# Altium schematic sheet ADC_LTC2122.SchDoc: ADC
size A3; SheetNumber: 5; SheetTotal: 17
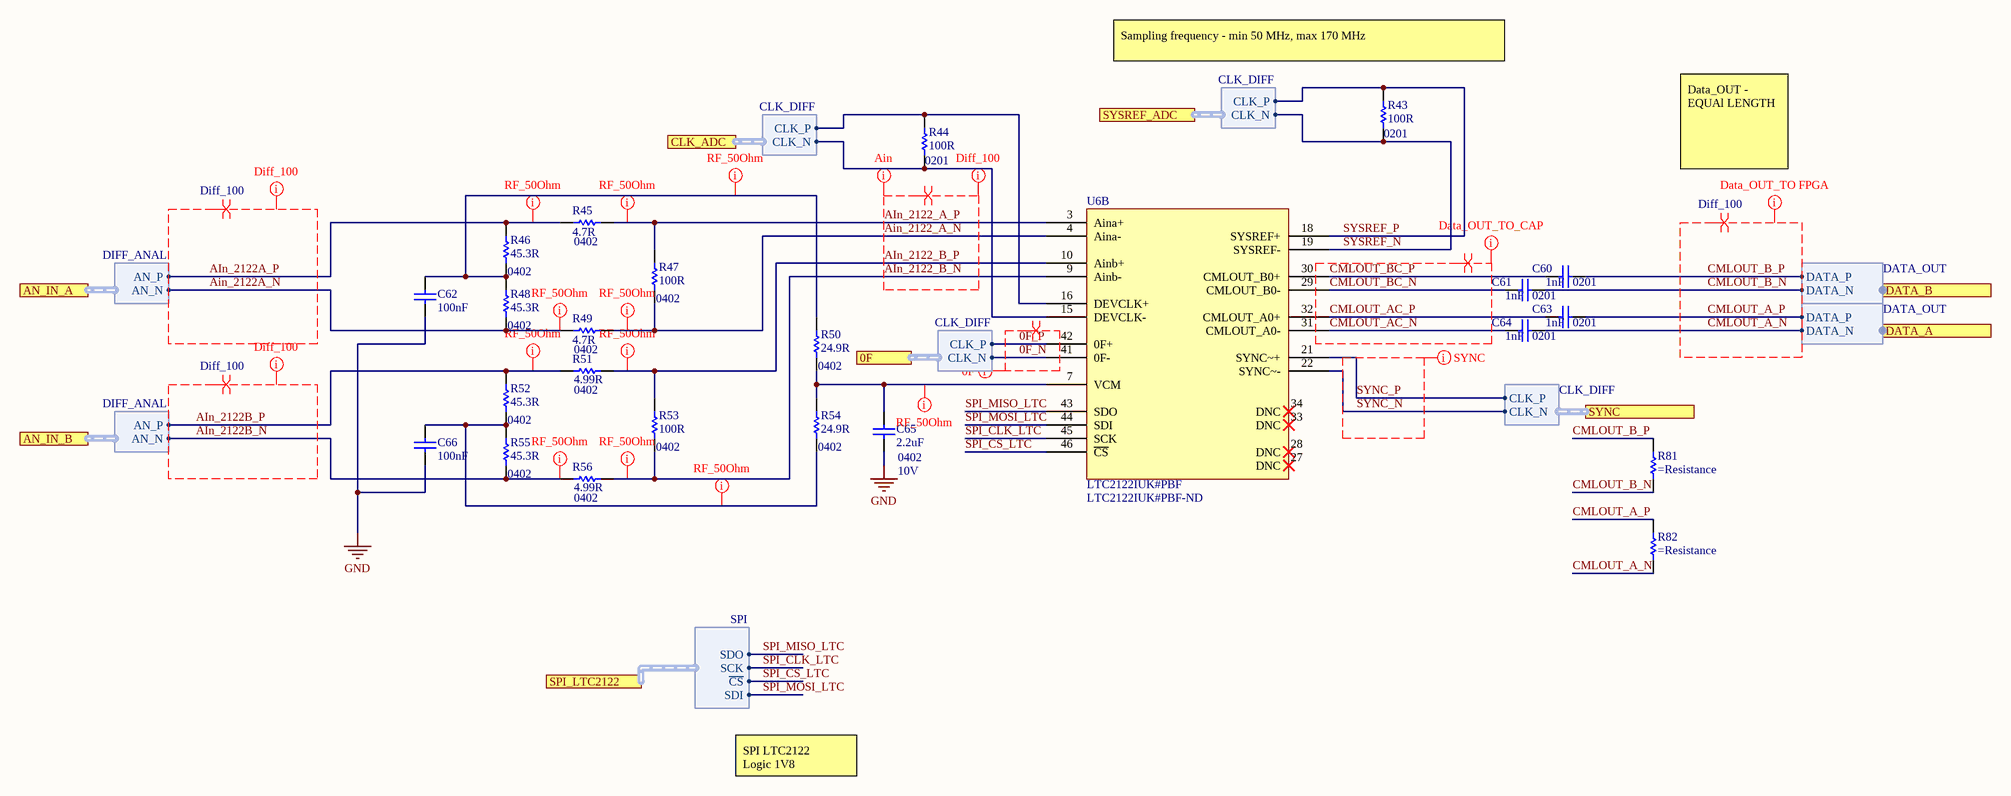
[diagram p0: ADC_LTC2122.SchDoc]

## Parts
C60  1nF  Case/Package: 0201  [CAP 0201/0603 KK]
C61  1nF  Case/Package: 0201  [CAP 0201/0603 KK]
C62  100nF  [CAP 0201/0603 KK]
C63  1nF  Case/Package: 0201  [CAP 0201/0603 KK]
C64  1nF  Case/Package: 0201  [CAP 0201/0603 KK]
C65  2.2uF  Case Code (Imperial): 0402  Voltage Rating: 10V  [CAP 0402/1005 RF KK]
C66  100nF  [CAP 0201/0603 KK]
R43  100R  Case/Package: 0201  [RES 0201/0603]
R44  100R  Case/Package: 0201  [RES 0201/0603]
R45  4.7R  Case/Package: 0402  [RES 0402/1005 RF KK]
R46  45.3R  Case Code (Imperial): 0402  [RES 0402/1005 RF KK]
R47  100R  Case/Package: 0402  [RES 0402/1005 RF KK]
R48  45.3R  Case Code (Imperial): 0402  [RES 0402/1005 RF KK]
R49  4.7R  Case/Package: 0402  [RES 0402/1005 RF KK]
R50  24.9R  Case/Package: 0402  [RES 0402/1005 RF KK]
R51  4.99R  Case/Package: 0402  [RES 0402/1005 RF KK]
R52  45.3R  Case Code (Imperial): 0402  [RES 0402/1005 RF KK]
R53  100R  Case/Package: 0402  [RES 0402/1005 RF KK]
R54  24.9R  Case/Package: 0402  [RES 0402/1005 RF KK]
R55  45.3R  Case Code (Imperial): 0402  [RES 0402/1005 RF KK]
R56  4.99R  Case/Package: 0402  [RES 0402/1005 RF KK]
R81  (no value)  [RES 0402/1005 RF KK]
R82  (no value)  [RES 0402/1005 RF KK]
U6  LTC2122IUK#PBF  Supplier Part Number 1: LTC2122IUK#PBF-ND  [LTC2122]  (part B of 2)

## Ports
0F (harness CLK_DIFF), AN_IN_A (harness DIFF_ANAL), AN_IN_B (harness DIFF_ANAL), CLK_ADC (harness CLK_DIFF), DATA_A (harness DATA_OUT), DATA_B (harness DATA_OUT), SPI_LTC2122 (harness SPI), SYNC (harness CLK_DIFF), SYSREF_ADC (harness CLK_DIFF)

## Harnesses
DIFF_ANAL: AN_P, AN_N
CLK_DIFF: CLK_P, CLK_N
DATA_OUT: DATA_P, DATA_N
SPI: SCK, ~{CS}, SDO, SDI

## Nets
GND: C62.1 C65.1 C66.1
0F_N: U6.41(0F-) ; port 0F.CLK_N
0F_P: U6.42(0F+) ; port 0F.CLK_P
Ain_2122_A_N: R47.1 R49.2 U6.4(Aina-)
AIn_2122_A_P: R45.2 R47.2 U6.3(Aina+)
AIn_2122_B_N: R53.1 R56.2 U6.9(Ainb-)
AIn_2122_B_P: R51.2 R53.2 U6.10(Ainb+)
Ain_2122A_N: R48.1 R49.1 ; port AN_IN_A.AN_N
AIn_2122A_P: R45.1 R46.2 ; port AN_IN_A.AN_P
AIn_2122B_N: R55.1 R56.1 ; port AN_IN_B.AN_N
AIn_2122B_P: R51.1 R52.2 ; port AN_IN_B.AN_P
CMLOUT_A_N: C64.2 R82.1 ; port DATA_A.DATA_N
CMLOUT_A_P: C63.2 R82.2 ; port DATA_A.DATA_P
CMLOUT_AC_N: C64.1 U6.31(CMLOUT_A0-)
CMLOUT_AC_P: C63.1 U6.32(CMLOUT_A0+)
CMLOUT_B_N: C61.2 R81.1 ; port DATA_B.DATA_N
CMLOUT_B_P: C60.2 R81.2 ; port DATA_B.DATA_P
CMLOUT_BC_N: C61.1 U6.29(CMLOUT_B0-)
CMLOUT_BC_P: C60.1 U6.30(CMLOUT_B0+)
SPI_CLK_LTC: U6.45(SCK) ; port SPI_LTC2122.SCK
SPI_CS_LTC: U6.46(~{CS}) ; port SPI_LTC2122.~{CS}
SPI_MISO_LTC: U6.43(SDO) ; port SPI_LTC2122.SDO
SPI_MOSI_LTC: U6.44(SDI) ; port SPI_LTC2122.SDI
SYNC_N: U6.22(SYNC~-) ; port SYNC.CLK_N
SYNC_P: U6.21(SYNC~+) ; port SYNC.CLK_P
SYSREF_N: R43.1 U6.19(SYSREF-) ; port SYSREF_ADC.CLK_N
SYSREF_P: R43.2 U6.18(SYSREF+) ; port SYSREF_ADC.CLK_P
NetC62_2: C62.2 R46.1 R48.2 R50.2
NetC65_2: C65.2 R50.1 R54.2 U6.7(VCM)
NetC66_2: C66.2 R52.1 R54.1 R55.2
NetR44_1: R44.1 U6.15(DEVCLK-) ; port CLK_ADC.CLK_N
NetR44_2: R44.2 U6.16(DEVCLK+) ; port CLK_ADC.CLK_P

Not connected (* = marked no-connect by the designer): U6 27(DNC)* 28(DNC)* 33(DNC)* 34(DNC)*

## Layout directives
net class Single50: Ain_2122_A_N, AIn_2122_A_P, AIn_2122_B_N, AIn_2122_B_P, Ain_2122A_N, AIn_2122A_P, AIn_2122B_N, AIn_2122B_P, NetC62_2, NetC65_2, NetC66_2
net class Diff_100: Ain_2122_A_N, AIn_2122_A_P, AIn_2122_B_N, AIn_2122_B_P, Ain_2122A_N, AIn_2122A_P, AIn_2122B_N, AIn_2122B_P
differential pair; differential pair class Diff_100: 0F_N, 0F_P, Ain_2122_A_N, AIn_2122_A_P, AIn_2122_B_N, AIn_2122_B_P, Ain_2122A_N, AIn_2122A_P, AIn_2122B_N, AIn_2122B_P, CMLOUT_A_N, CMLOUT_A_P, CMLOUT_AC_N, CMLOUT_AC_P, CMLOUT_B_N, CMLOUT_B_P, CMLOUT_BC_N, CMLOUT_BC_P
net class Ain: Ain_2122_A_N, AIn_2122_A_P, AIn_2122_B_N, AIn_2122_B_P
net class SYNC; net class Diff_100: SYNC_N, SYNC_P
net class Data_OUT_TO FPGA: CMLOUT_A_N, CMLOUT_A_P, CMLOUT_B_N, CMLOUT_B_P
net class Data_OUT_TO_CAP: CMLOUT_AC_N, CMLOUT_AC_P, CMLOUT_BC_N, CMLOUT_BC_P
net class 0F: 0F_N, 0F_P

## Notes on the sheet
- (near R43) Sampling frequency - min 50 MHz, max 170 MHz
- Data_OUT - EQUAl LENGTH
- SPI LTC2122
  Logic 1V8
- Title
- Size:
- Date:
- A3
- Number:
- Time:
- Revision:
- Sheet
- of
- File:

## Library data of the parts
C60 C61 C63 C64 = Capacitor: Cap Ceramic 0.001uF 25V X7R 10% SMD 0201 125°C Paper T/R; Manufacturer: Murata; Manufacturer Part Number: GRM033R71E102KA01J; Supplier 1: Digi-Key; Supplier Part Number 1: 490-8161-1-ND; RoHS: Yes; Category: Ceramic Capacitors; Stock 1: 140332; Pricing 1: 1=0,10000, 10=0,02900, 100=0,01300, 500=0,00932, 1000=0,00732, 2500=0,00666, 5000=0,00612 (USD); Mount: Surface Mount; Case Code (Metric): 0603; Case Code (Imperial): 0201; Min Operating Temperature: -55°C; Max Operating Temperature: 125°C; Package Quantity: 50000; Packaging: Tape and Reel; Capacitance: 1nF; Tolerance: 10%; Voltage Rating: 25V; Voltage Rating (DC): 25V; Termination: SMD/SMT; Dielectric: X7R; Length: 0.6mm; Height: 0.3mm; Width: 0.012inch; Thickness: 0.013inch; Depth: 0.3mm; Radiation Hardening: No; ComponentLink1URL: https://datasheet.ciiva.com/5453/product-5453157.pdf?src-supplier=Mouser; ComponentLink1Description: https://datasheet.ciiva.com/5453/product-5453157.pdf?src-supplier=Mouser; ComponentLink2URL: https://datasheet.ciiva.com/11621/product-11621675.pdf?src-supplier=Avnet; ComponentLink2Description: https://datasheet.ciiva.com/11621/product-11621675.pdf?src-supplier=Avnet
C62 C66 = Capacitor: Manufacturer 1: Murata; Manufacturer Part Number 1: GRM033R61C104ME84D; Voltage Rating: 16V; Tolerance: 20%; Dielectric: X5R; Supplier 1: Digi-Key; Supplier Part Number 1: 490-9986-1-ND; Stock 1: 503570; Pricing 1: 1=0.10000, 10=0.05400, 100=0.02430, 500=0.01732, 1000=0.01361, 2500=0.01238, 5000=0.01139 (USD); RoHS: Yes; Mount: Surface Mount; Case/Package: 0201; Weight: 1.2E-05oz; Case Code (Metric): 0603; Case Code (Imperial): 0201; Min Operating Temperature: -55°C; Max Operating Temperature: 85°C; Capacitance: 100nF; Packaging: Tape and Reel; Termination: SMD/SMT; Voltage Rating (DC): 16V; Package Quantity: 15000; Length: 0.024inch; Height: 0.3mm; Width: 0.3mm; Thickness: 0.013inch; ComponentLink1URL: http://www.mouser.com/ds/2/281/c02e-2905.pdf?src-supplier=Mouser; ComponentLink1Description: http://www.mouser.com/ds/2/281/c02e-2905.pdf?src-supplier=Mouser; ComponentLink2URL: http://search.murata.co.jp/Ceramy/image/img/A01X/G101/ENG/GRM033R61C104ME84-01.pdf?src-supplier=Digi-Key; ComponentLink2Description: http://search.murata.co.jp/Ceramy/image/img/A01X/G101/ENG/GRM033R61C104ME84-01.pdf?src-supplier=Digi-Key
C65 = Capacitor: MURATA - GRM155R61A225KE95D - Keramikvielschichtkondensator, SMD, 2.2 µF, 10 V, 0402 [Metrisch 1005], ± 10%, X5R, Baureihe GRM; Material: Ceramic; Supplier 1: Digi-Key; Supplier Part Number 1: 490-10451-1-ND; Manufacturer: Murata; Manufacturer Part Number: GRM155R61A225KE95D; RoHS: Yes; Category: Ceramic Capacitors; Stock 1: 2215146; Pricing 1: 1=0,11000, 10=0,08100, 100=0,03800, 500=0,02664, 1000=0,02205, 2500=0,02052, 5000=0,01878 (USD); Mount: Surface Mount; Case/Package: 0402; Weight: 0.000212oz; Case Code (Metric): 1005; Min Operating Temperature: -55°C; Max Operating Temperature: 85°C; Dielectric: X5R; Termination: SMD/SMT; Voltage Rating (DC): 10V; Package Quantity: 10000; Capacitance: 2.2uF; Tolerance: 10%; Packaging: Tape and Reel; Length: 1mm; Height: 0.5mm; Thickness: 0.022inch; Depth: 0.5mm; Width: 0.5mm; REACH SVHC: No SVHC; Lead Free: Lead Free; ComponentLink1URL: http://www.mouser.com/ds/2/281/c02e-2905.pdf?src-supplier=Mouser; ComponentLink1Description: http://www.mouser.com/ds/2/281/c02e-2905.pdf?src-supplier=Mouser; ComponentLink2URL: http://components.arrow.com/part/dataview/0323_04264073?src-supplier=Arrow+Europe; ComponentLink2Description: http://components.arrow.com/part/dataview/0323_04264073?src-supplier=Arrow+Europe; ComponentLink3URL: http://www.farnell.com/datasheets/1872202.pdf?src-supplier=Farnell; ComponentLink3Description: http://www.farnell.com/datasheets/1872202.pdf?src-supplier=Farnell; ComponentLink4URL: http://www.farnell.com/datasheets/2047915.pdf?src-supplier=Farnell; ComponentLink4Description: http://www.farnell.com/datasheets/2047915.pdf?src-supplier=Farnell; ComponentLink5URL: http://www.farnell.com/datasheets/1872202.pdf?src-supplier=Element14; ComponentLink5Description: http://www.farnell.com/datasheets/1872202.pdf?src-supplier=Element14; ComponentLink6URL: http://www.farnell.com/datasheets/1872202.pdf?src-supplier=Newark; ComponentLink6Description: http://www.farnell.com/datasheets/1872202.pdf?src-supplier=Newark; ComponentLink7URL: http://psearch.en.murata.com/capacitor/product/GRM155R61A225KE95%23.pdf?src-supplier=Avnet; ComponentLink7Description: http://psearch.en.murata.com/capacitor/product/GRM155R61A225KE95%23.pdf?src-supplier=Avnet; ComponentLink8URL: http://www.farnell.com/datasheets/2047915.pdf?src-supplier=Element14; ComponentLink8Description: http://www.farnell.com/datasheets/2047915.pdf?src-supplier=Element14; ComponentLink9URL: https://search.murata.co.jp/Ceramy/image/img/A01X/G101/ENG/GRM155R61A225KE95-01.pdf?src-supplier=Digi-Key; ComponentLink9Description: https://search.murata.co.jp/Ceramy/image/img/A01X/G101/ENG/GRM155R61A225KE95-01.pdf?src-supplier=Digi-Key; ComponentLink10URL: http://www.farnell.com/datasheets/2047915.pdf?src-supplier=Newark; ComponentLink10Description: http://www.farnell.com/datasheets/2047915.pdf?src-supplier=Newark
R43 R44 = Resistor: Res Thick Film 0201 100 Ohm 1% 1/20W 200ppm/C Molded SMD SMD Paper T/R; Manufacturer: Yageo; Manufacturer Part Number: RC0201FR-07100RL; Power Rating: 50mW; Voltage Rating: 25V; Temperature Coefficient: 200ppm/°C; Supplier 1: Digi-Key; Supplier Part Number 1: 311-100MCT-ND; RoHS: Yes; Category: Chip SMD Resistors; Stock 1: 576597; Pricing 1: 1=0,10000, 10=0,04000, 100=0,01650, 1000=0,00739, 2500=0,00642, 5000=0,00530 (USD); Case Code (Metric): 0603; Case Code (Imperial): 0201; Contact Plating: Tin,Matte; Min Operating Temperature: -55°C; Max Operating Temperature: 125°C; Resistance: 100R; Tolerance: 1%; Packaging: Tape and Reel; Package Quantity: 1; Max Power Dissipation: 50mW; Composition: Thick Film; Number of Terminations: 2; Termination: SMD/SMT; Features: Moisture Resistant; Length: 0.024inch; Height: 0.01inch; Width: 0.012inch; Radiation Hardening: No; REACH SVHC: Unknown; Lead Free: Lead Free; ComponentLink1URL: https://datasheet.ciiva.com/2560/pyu-r-int-thick-7-2560866.pdf?src-supplier=Digi-Key; ComponentLink1Description: https://datasheet.ciiva.com/2560/pyu-r-int-thick-7-2560866.pdf?src-supplier=Digi-Key; ComponentLink2URL: https://datasheet.ciiva.com/28395/pyu-rc0201-51-rohs-l-8-28395391.pdf?src-supplier=Avnet+Europe; ComponentLink2Description: https://datasheet.ciiva.com/28395/pyu-rc0201-51-rohs-l-8-28395391.pdf?src-supplier=Avnet+Europe; ComponentLink3URL: https://datasheet.ciiva.com/2560/pyu-r-int-thick-7-2560865.pdf?src-supplier=Digi-Key; ComponentLink3Description: https://datasheet.ciiva.com/2560/pyu-r-int-thick-7-2560865.pdf?src-supplier=Digi-Key; ComponentLink4URL: https://datasheet.ciiva.com/2560/pyu-r-int-thick-7-2560867.pdf?src-supplier=Digi-Key; ComponentLink4Description: https://datasheet.ciiva.com/2560/pyu-r-int-thick-7-2560867.pdf?src-supplier=Digi-Key; ComponentLink5URL: https://datasheet.ciiva.com/16855/pyu-rc0201-51-rohs-l-8-16855781.pdf?src-supplier=Avnet+Europe; ComponentLink5Description: https://datasheet.ciiva.com/16855/pyu-rc0201-51-rohs-l-8-16855781.pdf?src-supplier=Avnet+Europe; ComponentLink6URL: https://datasheet.ciiva.com/8887/pyu-rc0201-51-rohs-l-8-8887865.pdf?src-supplier=Avnet; ComponentLink6Description: https://datasheet.ciiva.com/8887/pyu-rc0201-51-rohs-l-8-8887865.pdf?src-supplier=Avnet
R45 R49 = Resistor: RES SMD 4.7 OHM 1% 1/6W 0402; Manufacturer: Susumu; Manufacturer Part Number: RL0510S-4R7-F; Temperature Coefficient: 200ppm/°C; Max Power Dissipation: 167mW; Supplier 1: Digi-Key; Supplier Part Number 1: RL05S4.7FCT-ND; RoHS: Yes; Category: Chip SMD Resistors; Stock 1: 39223; Pricing 1: 1=0,37000, 10=0,28300, 25=0,21480, 50=0,15980, 100=0,11880, 250=0,10032, 500=0,08600, 1000=0,06552, 5000=0,05569 (USD); Weight: 2.3E-05oz; Case Code (Metric): 1005; Case Code (Imperial): 0402; Min Operating Temperature: -55°C; Max Operating Temperature: 125°C; Package Quantity: 1; Resistance: 4.7R; Tolerance: 1%; Packaging: Tape and Reel; Resistor Type: Thin Film; Number of Terminations: 2; Termination: SMD/SMT; Length: 0.039inch; Height: 0.018inch; Width: 0.02inch; Lead Free: Lead Free; ComponentLink1URL: https://datasheet.ciiva.com/2488/rl-data-sheet-2488416.pdf?src-supplier=Digi-Key; ComponentLink1Description: https://datasheet.ciiva.com/2488/rl-data-sheet-2488416.pdf?src-supplier=Digi-Key; ComponentLink2URL: https://datasheet.ciiva.com/12913/e-15-16-12913189.pdf?src-supplier=Mouser; ComponentLink2Description: https://datasheet.ciiva.com/12913/e-15-16-12913189.pdf?src-supplier=Mouser; ComponentLink3URL: https://datasheet.ciiva.com/2488/rl-data-sheet-2488414.pdf?src-supplier=Digi-Key; ComponentLink3Description: https://datasheet.ciiva.com/2488/rl-data-sheet-2488414.pdf?src-supplier=Digi-Key; ComponentLink4URL: https://datasheet.ciiva.com/2488/rl-data-sheet-2488415.pdf?src-supplier=Digi-Key; ComponentLink4Description: https://datasheet.ciiva.com/2488/rl-data-sheet-2488415.pdf?src-supplier=Digi-Key
R46 R48 R52 R55 = Resistor: Resistor;  Thick Film;  45.3 Ohms;  0.063 W;  1%;  SMT;  0402;  TCR 37 ppm/DegC;  Tape and Reel; Manufacturer: Vishay; Manufacturer Part Number: CRCW040245R3FKED; Temperature Coefficient: 100ppm/°C; Voltage Rating (DC): 50V; Power Rating: 63mW; Supplier 1: Digi-Key; Supplier Part Number 1: 541-45.3LCT-ND; RoHS: Yes; Category: Chip SMD Resistors; Stock 1: 32000; Pricing 1: 1=0,10000, 10=0,03600, 100=0,01470, 1000=0,00660, 2500=0,00573, 5000=0,00473 (USD); Mount: Surface Mount; Case/Package: 0402; Number of Pins: 2; Weight: 2.3E-05oz; Contact Plating: Tin; Case Code (Metric): 1005; Min Operating Temperature: -55°C; Max Operating Temperature: 155°C; Composition: Thick Film; Resistance: 45.3R; Tolerance: 1%; Packaging: Tape and Reel; Package Quantity: 10000; Military Standard: Not; Termination: Solder; Voltage Rating: 50V; Length: 1mm; Height: 0.35mm; Width: 0.5mm; Depth: 0.5mm; Radiation Hardening: No; Lead Free: Lead Free; REACH SVHC: Unknown; ComponentLink1URL: https://datasheet.ciiva.com/22705/1697337-22705525.pdf?src-supplier=Element14; ComponentLink1Description: https://datasheet.ciiva.com/22705/1697337-22705525.pdf?src-supplier=Element14; ComponentLink2URL: https://datasheet.ciiva.com/5548/dcrcwe3-109170-5548089.pdf?src-supplier=Mouser; ComponentLink2Description: https://datasheet.ciiva.com/5548/dcrcwe3-109170-5548089.pdf?src-supplier=Mouser; ComponentLink3URL: https://datasheet.ciiva.com/7732/1697337-7732015.pdf?src-supplier=Element14; ComponentLink3Description: https://datasheet.ciiva.com/7732/1697337-7732015.pdf?src-supplier=Element14; ComponentLink4URL: https://datasheet.ciiva.com/7743/125364-7743653.pdf?src-supplier=Element14; ComponentLink4Description: https://datasheet.ciiva.com/7743/125364-7743653.pdf?src-supplier=Element14; ComponentLink5URL: https://datasheet.ciiva.com/3256/dcrcwe3-3256541.pdf?src-supplier=Avnet; ComponentLink5Description: https://datasheet.ciiva.com/3256/dcrcwe3-3256541.pdf?src-supplier=Avnet; ComponentLink6URL: https://datasheet.ciiva.com/16781/70201119-16781759.pdf?src-supplier=Allied+Electronics; ComponentLink6Description: https://datasheet.ciiva.com/16781/70201119-16781759.pdf?src-supplier=Allied+Electronics
R47 R53 = Resistor: YAGEO - RC0402FR-07100RL. - RES, THICK FILM, 100R, 1%, 0.0625W, 0402, REEL; Temperature Coefficient: 100ppm/°C; Power Rating: 62.5mW; Voltage Rating: 50V; Supplier 1: Digi-Key; Supplier Part Number 1: 311-100LRCT-ND; Manufacturer: Yageo; Manufacturer Part Number: RC0402FR-07100RL; RoHS: Yes; Category: Chip SMD Resistors; Stock 1: 31356128; Pricing 1: 1=0,10000, 10=0,01600, 100=0,00640, 1000=0,00289, 2500=0,00251, 5000=0,00207 (USD); Number of Pins: 2; Case Code (Imperial): 0402; Case Code (Metric): 1005; Min Operating Temperature: -55°C; Max Operating Temperature: 155°C; Military Standard: Not; Tolerance: 1%; Resistance: 100R; Packaging: Tape and Reel; Termination: SMD/SMT; Composition: Thick Film; Voltage Rating (DC): 50V; Length: 1mm; Height: 0.32mm; Depth: 0.5mm; Width: 0.5mm; Lead Free: Lead Free; REACH SVHC: No SVHC; ComponentLink1URL: https://datasheet.ciiva.com/7849/1784430-7849810.pdf?src-supplier=Element14; ComponentLink1Description: https://datasheet.ciiva.com/7849/1784430-7849810.pdf?src-supplier=Element14; ComponentLink2URL: https://datasheet.ciiva.com/11808/0900766b80c66297-11808765.pdf?src-supplier=RSComponents; ComponentLink2Description: https://datasheet.ciiva.com/11808/0900766b80c66297-11808765.pdf?src-supplier=RSComponents; ComponentLink3URL: https://datasheet.ciiva.com/16740/pyu-rc0402-51-rohs-l-6-r-16740566.pdf?src-supplier=Future+Electronics; ComponentLink3Description: https://datasheet.ciiva.com/16740/pyu-rc0402-51-rohs-l-6-r-16740566.pdf?src-supplier=Future+Electronics; ComponentLink4URL: https://datasheet.ciiva.com/15189/getdatasheetpartid-329466-15189335.pdf?src-supplier=Verical; ComponentLink4Description: https://datasheet.ciiva.com/15189/getdatasheetpartid-329466-15189335.pdf?src-supplier=Verical; ComponentLink5URL: https://datasheet.ciiva.com/28367/1018594-28367226.pdf?src-supplier=Element14; ComponentLink5Description: https://datasheet.ciiva.com/28367/1018594-28367226.pdf?src-supplier=Element14; ComponentLink6URL: https://datasheet.ciiva.com/12667/pyu-rc0402-51-rohs-l-6-r-12667957.pdf?src-supplier=Mouser; ComponentLink6Description: https://datasheet.ciiva.com/12667/pyu-rc0402-51-rohs-l-6-r-12667957.pdf?src-supplier=Mouser; ComponentLink7URL: https://datasheet.ciiva.com/22747/1018594-22747511.pdf?src-supplier=Element14; ComponentLink7Description: https://datasheet.ciiva.com/22747/1018594-22747511.pdf?src-supplier=Element14
R50 R54 = Resistor: RES SMD 24.9 OHM 0.1% 1/16W 0402; Manufacturer: Yageo; Manufacturer Part Number: RT0402BRD0724R9L; Voltage Rating: 50V; Power Rating: 62.5mW; Max Power Dissipation: 63mW; Temperature Coefficient: 25ppm/°C; Supplier 1: Digi-Key; Supplier Part Number 1: YAG4216CT-ND; RoHS: Yes; Category: Chip SMD Resistors; Stock 1: 12162; Pricing 1: 1=0,41000, 10=0,29200, 100=0,11690, 1000=0,05762, 2500=0,05338, 5000=0,04830 (USD); Case Code (Metric): 1005; Case Code (Imperial): 0402; Min Operating Temperature: -55°C; Max Operating Temperature: 125°C; Tolerance: 0.1%; Resistance: 24.9R; Packaging: Tape and Reel; Package Quantity: 10000; Termination: SMD/SMT; Number of Terminations: 2; Composition: Thin Film; Voltage Rating (DC): 50V; Length: 0.039inch; Height: 0.014inch; Width: 0.02inch; Lead Free: Lead Free; ComponentLink1URL: https://datasheet.ciiva.com/2582/pyu-rt-1-to-0-05-rohs-l-5-2582254.pdf?src-supplier=Digi-Key; ComponentLink1Description: https://datasheet.ciiva.com/2582/pyu-rt-1-to-0-05-rohs-l-5-2582254.pdf?src-supplier=Digi-Key
R51 R56 = Resistor: RES SMD 4.99 OHM 1% 1/16W 0402; Manufacturer: Vishay; Manufacturer Part Number: CRCW04024R99FKEDC; Max Power Dissipation: 63mW; Temperature Coefficient: 100ppm/°C; Supplier 1: Digi-Key; Supplier Part Number 1: 541-4085-1-ND; RoHS: No; Stock 1: 341364; Pricing 1: 1=0,10000, 10=0,09300, 100=0,03580, 1000=0,01573, 2500=0,01358, 5000=0,01216 (USD); Case Code (Imperial): 0402; Case Code (Metric): 1005; Min Operating Temperature: -55°C; Max Operating Temperature: 155°C; Composition: Thick Film; Packaging: Tape and Reel; Resistance: 4.99R; Tolerance: 1%; Number of Terminations: 2; ComponentLink1URL: http://www.vishay.com/docs/28773/crcwce3.pdf?src-supplier=Digi-Key; ComponentLink1Description: http://www.vishay.com/docs/28773/crcwce3.pdf?src-supplier=Digi-Key
R81 R82 = Resistor
U6 = LTC2122IUK#PBF: IC ADC 14BIT 170MSPS 48QFN; Manufacturer: Analog Devices / Linear Technology; Number of Bits: 14; Sampling Rate: 170000000S/s; Number of Inputs: 2; Min Supply Voltage: 1.7V; Max Supply Voltage: 1.9V; Interface: SPI; Resolution: 14b; Supplier 1: Digi-Key; Manufacturer Part Number: LTC2122IUK#PBF; RoHS: Yes; Category: Analog to Digital Converters (ADCs); Stock 1: 52; Pricing 1: 1=105,29000, 25=102,14040 (USD); Case/Package: QFN; Number of Pins: 48; Min Operating Temperature: -40°C; Max Operating Temperature: 85°C; Packaging: Tray; Number of A/D Converters: 2; REACH SVHC: No SVHC; ComponentLink1URL: http://www.linear.com/docs/45350?src-supplier=Digi-Key; ComponentLink1Description: http://www.linear.com/docs/45350?src-supplier=Digi-Key; ComponentLink2URL: http://www.farnell.com/datasheets/1968213.pdf?src-supplier=Element14; ComponentLink2Description: http://www.farnell.com/datasheets/1968213.pdf?src-supplier=Element14